# Altium project EVLSERVO1_control_v2.PrjPcb (part 6 of 9)
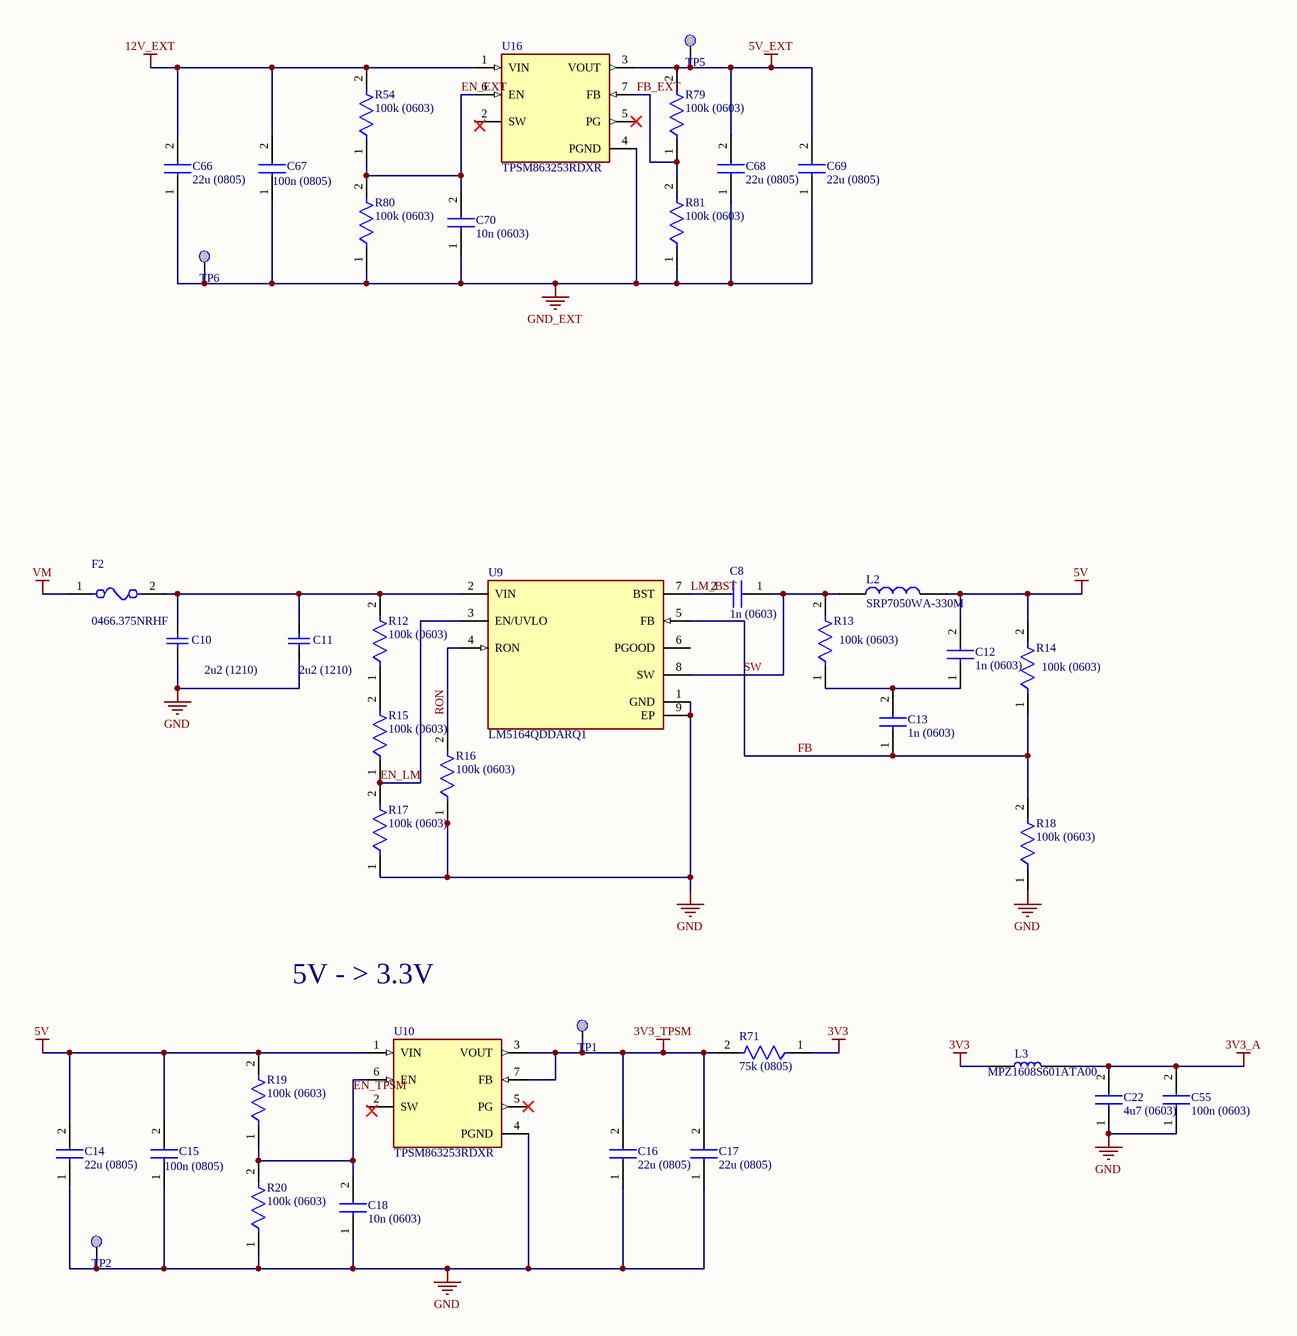
[diagram p9: power.SchDoc]

## Sheet power.SchDoc (continued)

### Library data of the parts (continued)
R19 R20 R54 R79-R81 = SR0603FR-7T100KL: Res Thick Film 0603 100K Ohm 1% 0.25W(1/4W) ±100ppm/°C Pad SMD T/R Automotive AEC-Q200; Manufacturer_Name: Yageo Group; Manufacturer_Part_Number: SR0603FR-7T10KL; Power Rating: 250mW; Value: 10kΩ; Voltage Rating: 75V; Working Voltage: 150V; Datasheet Link: https://mouser.componentsearchengine.com/Datasheets/1/SR0603FR-7T10KL.pdf; Height: 0.55mm; Mouser Part Number: 603-SR0603FR-7T10KL; Mouser Price/Stock: https://www.mouser.co.uk/ProductDetail/YAGEO/SR0603FR-7T10KL?qs=pfd5qewlna6IurLw3u3uRA%3D%3D; Arrow Part Number: SR0603FR-7T10KL; Arrow Price/Stock: https://www.arrow.com/en/products/sr0603fr-7t10kl/yageo; Supplier: DigiKey; Supplier Part Number: YAG5823CT-ND; Manufacturer: Yageo Group; Manufacturer Part Number: SR0603FR-7T10KL; RoHS: Compliant; Category: Chip SMD Resistors; Pricing: 1=0,67, 10=0,399, 25=0,3376, 50=0,3022, 100=0,2744, 250=0,24612, 500=0,22976, 1000=0,21675 (USD); Case/Package: 0603; China RoHS: Non-Compliant; Composition: Thick Film; Country of Origin: Mainland China, Taiwan; Export Control Classification Number (ECCN) Code: EAR99; Harmonized Tariff Schedule (HTS) Code: 8533.21.00.30; Introduction Date: 2017-10-02; Length: 1.6mm; Lifecycle Status: Production; Max Operating Temperature: 155°C; Min Operating Temperature: -55°C; Mounting Technology: Surface Mount; Number of Terminals: 2; Packaging: Tape & Reel; Ratings: AEC-Q200; REACH SVHC: Yes; Temperature Coefficient: 100ppm/°C; Tolerance: 1%; Width: 800µm; ComponentLink1URL: https://datasheet.octopart.com:443/SR0603FR-7T10KL-Yageo-datasheet-176402240.pdf?src-supplier=Farnell; ComponentLink1Description: https://datasheet.octopart.com:443/SR0603FR-7T10KL-Yageo-datasheet-176402240.pdf?src-supplier=Farnell; ComponentLink2URL: https://datasheet.octopart.com:443/SR0603FR-7T10KL-Yageo-datasheet-119732217.pdf?src-supplier=Upverter; ComponentLink2Description: https://datasheet.octopart.com:443/SR0603FR-7T10KL-Yageo-datasheet-119732217.pdf?src-supplier=Upverter; ComponentLink3URL: https://datasheet.octopart.com:443/SR0603FR-7T10KL-Yageo-Group-datasheet-184785656.pdf?src-supplier=Future+Electronics; ComponentLink3Description: https://datasheet.octopart.com:443/SR0603FR-7T10KL-Yageo-Group-datasheet-184785656.pdf?src-supplier=Future+Electronics; ComponentLink4URL: https://datasheet.octopart.com:443/SR0603FR-7T10KL-Yageo-datasheet-155675517.pdf?src-supplier=Future+Electronics; ComponentLink4Description: https://datasheet.octopart.com:443/SR0603FR-7T10KL-Yageo-datasheet-155675517.pdf?src-supplier=Future+Electronics; ComponentLink5URL: https://datasheet.octopart.com:443/SR0603FR-7T10KL-Yageo-datasheet-137701088.pdf?src-supplier=Future+Electronics; ComponentLink5Description: https://datasheet.octopart.com:443/SR0603FR-7T10KL-Yageo-datasheet-137701088.pdf?src-supplier=Future+Electronics; ComponentLink6URL: https://datasheet.octopart.com/SR0603FR-7T10KL-Yageo-datasheet-11047080.pdf; ComponentLink6Description: https://datasheet.octopart.com/SR0603FR-7T10KL-Yageo-datasheet-11047080.pdf; ComponentLink7URL: http://sigma.octopart.com:80/conflict_mineral_statement/Yageo-company-3.pdf?src-supplier=Compliance+Statements; ComponentLink7Description: http://sigma.octopart.com:80/conflict_mineral_statement/Yageo-company-3.pdf?src-supplier=Compliance+Statements; ComponentLink8URL: http://sigma.octopart.com:80/rohs_statement/Yageo-company-2.pdf?src-supplier=Compliance+Statements; ComponentLink8Description: http://sigma.octopart.com:80/rohs_statement/Yageo-company-2.pdf?src-supplier=Compliance+Statements; Stock: 5000; ComponentLink9URL: https://datasheet.octopart.com:443/SR0603FR-7T4R7L-Yageo-datasheet-176402240.pdf?src-supplier=Farnell; ComponentLink9Description: https://datasheet.octopart.com:443/SR0603FR-7T4R7L-Yageo-datasheet-176402240.pdf?src-supplier=Farnell; ComponentLink10URL: https://datasheet.octopart.com:443/SR0603FR-7T4R7L-Yageo-datasheet-119732217.pdf?src-supplier=Upverter; ComponentLink10Description: https://datasheet.octopart.com:443/SR0603FR-7T4R7L-Yageo-datasheet-119732217.pdf?src-supplier=Upverter; ComponentLink11URL: https://datasheet.octopart.com:443/SR0603FR-7T4R7L-Yageo-Group-datasheet-184785656.pdf?src-supplier=Future+Electronics; ComponentLink11Description: https://datasheet.octopart.com:443/SR0603FR-7T4R7L-Yageo-Group-datasheet-184785656.pdf?src-supplier=Future+Electronics; ComponentLink12URL: https://datasheet.octopart.com:443/SR0603FR-7T4R7L-Yageo-datasheet-155675517.pdf?src-supplier=Future+Electronics; ComponentLink12Description: https://datasheet.octopart.com:443/SR0603FR-7T4R7L-Yageo-datasheet-155675517.pdf?src-supplier=Future+Electronics; ComponentLink13URL: https://datasheet.octopart.com:443/SR0603FR-7T4R7L-Yageo-datasheet-137701088.pdf?src-supplier=Future+Electronics; ComponentLink13Description: https://datasheet.octopart.com:443/SR0603FR-7T4R7L-Yageo-datasheet-137701088.pdf?src-supplier=Future+Electronics; ComponentLink14URL: https://datasheet.octopart.com/SR0603FR-7T4R7L-Yageo-datasheet-11047080.pdf; ComponentLink14Description: https://datasheet.octopart.com/SR0603FR-7T4R7L-Yageo-datasheet-11047080.pdf; Schedule B: 8533210045, 8533210045|8533210045|8533210045|8533210045|8533210045; ComponentLink15URL: https://datasheet.octopart.com:443/SR0603FR-7T100KL-Yageo-datasheet-176402240.pdf?src-supplier=element14+APAC; ComponentLink15Description: https://datasheet.octopart.com:443/SR0603FR-7T100KL-Yageo-datasheet-176402240.pdf?src-supplier=element14+APAC; ComponentLink16URL: https://datasheet.octopart.com:443/SR0603FR-7T100KL-Yageo-datasheet-119732217.pdf?src-supplier=Upverter; ComponentLink16Description: https://datasheet.octopart.com:443/SR0603FR-7T100KL-Yageo-datasheet-119732217.pdf?src-supplier=Upverter; ComponentLink17URL: https://datasheet.octopart.com:443/SR0603FR-7T100KL-Yageo-Group-datasheet-184785656.pdf?src-supplier=Future+Electronics; ComponentLink17Description: https://datasheet.octopart.com:443/SR0603FR-7T100KL-Yageo-Group-datasheet-184785656.pdf?src-supplier=Future+Electronics; ComponentLink18URL: https://datasheet.octopart.com:443/SR0603FR-7T100KL-Yageo-datasheet-155675517.pdf?src-supplier=Future+Electronics; ComponentLink18Description: https://datasheet.octopart.com:443/SR0603FR-7T100KL-Yageo-datasheet-155675517.pdf?src-supplier=Future+Electronics; ComponentLink19URL: https://datasheet.octopart.com:443/SR0603FR-7T100KL-Yageo-datasheet-137701088.pdf?src-supplier=Future+Electronics; ComponentLink19Description: https://datasheet.octopart.com:443/SR0603FR-7T100KL-Yageo-datasheet-137701088.pdf?src-supplier=Future+Electronics; ComponentLink20URL: https://datasheet.octopart.com/SR0603FR-7T100KL-Yageo-datasheet-11047080.pdf; ComponentLink20Description: https://datasheet.octopart.com/SR0603FR-7T100KL-Yageo-datasheet-11047080.pdf
R71 = RQ73C2A75KBTD: Fixed Resistor, Thin Film, 0.2W, 75000ohm, 100V, 0.1% +/-Tol, 10ppm/Cel, Surface Mount, 0805; Manufacturer Part Number: SR0805FR-7W4R7L; Manufacturer: Yageo; Manufacturer Lifecycle Status: ACTIVE; Automotive Grade: Grade 0; Resistance: 4.7Ω; Tolerance: 0.01; Voltage Rating: 150V; Value: 4.7Ω; Power Rating: 0.25W; Temperature Coefficient: 10ppm/°C; Temperature Range High: +155°C; Digikey Description: RES SMD 4.7 OHM 1% 1/4W 0805; RoHS: TRUE; Ipc Land Pattern Name: RESC200125X50; Category: Res; Automotive: Yes; Device Class L2: Resistors; ComponentLink2Description: Datasheet; Device Class L1: Passive Components; Temperature Range Low: -55°C; Lead Free: Yes; Footprint Url: http://www.yageo.com/exep/pages/download/literatures/PYu-R_Mount_10.pdf; Octopart: https://octopart.com/sr0805fr-7w4r7l-yageo-71414350; Height: 0.6mm; Composition: Thick Film; Device Class L3: Chip SMD Resistors; Series: SR; ComponentLink2URL: http://www.yageo.com/documents/recent/PYu-SR_D_F%20tol_RoHS_L_3.pdf; Package: SR0805; Temperature: -55°C to +155°C; Supplier: Farnell; Supplier Part Number: RQ73C2A75KBTD; Stock: 3515; Case/Package: 0805; China RoHS: Compliant; Length: 2mm; Lifecycle Status: Production; Max Operating Temperature: 155°C; Min Operating Temperature: -55°C; Mounting Technology: Surface Mount; Number of Terminals: 2; Operating Supply Voltage: 100V; Ratings: AEC-Q200; REACH SVHC: Yes; Width: 1.25mm; Working Voltage: 100V; ComponentLink1URL: https://datasheet.octopart.com:443/RQ73C2A75KBTD-TE-Connectivity-datasheet-179163842.pdf?src-supplier=IHS; ComponentLink1Description: https://datasheet.octopart.com:443/RQ73C2A75KBTD-TE-Connectivity-datasheet-179163842.pdf?src-supplier=IHS; ComponentLink3URL: https://datasheet.octopart.com:443/RQ73C2A75KBTD-TE-Connectivity-datasheet-141404639.pdf?src-supplier=Upverter; ComponentLink3Description: https://datasheet.octopart.com:443/RQ73C2A75KBTD-TE-Connectivity-datasheet-141404639.pdf?src-supplier=Upverter; ComponentLink4URL: https://datasheet.octopart.com:443/RQ73C2A75KBTD-TE-Connectivity-datasheet-129104565.pdf?src-supplier=Electro+Sonic; ComponentLink4Description: https://datasheet.octopart.com:443/RQ73C2A75KBTD-TE-Connectivity-datasheet-129104565.pdf?src-supplier=Electro+Sonic; ComponentLink5URL: https://sigma.octopart.com:443/129121914/technical_drawing/TE-Connectivity-RQ73C2A75KBTD.pdf?src-supplier=TE+Connectivity; ComponentLink5Description: https://sigma.octopart.com:443/129121914/technical_drawing/TE-Connectivity-RQ73C2A75KBTD.pdf?src-supplier=TE+Connectivity; ComponentLink6URL: https://datasheet.octopart.com:443/7-2176381-6-TE-Connectivity-datasheet-181572785.pdf?src-supplier=Sager+Electronics; ComponentLink6Description: https://datasheet.octopart.com:443/7-2176381-6-TE-Connectivity-datasheet-181572785.pdf?src-supplier=Sager+Electronics
TP1 TP2 TP5 TP6 = TestPoint: Standard test point 1mm
U9 = CMP-04918-000331-1: POWER MANAGEMENT; RoHS Compliant: Yes
U10 U16 = TPSM863253RDXR: 3V to 17V input voltage, 3.3V, 3A output synchronous buck module in QFN package 7-QFN-FCMOD -40 to 125; Manufacturer Lifecycle Status: ACTIVE; MF: Texas Instruments; SnapEDA_Link: https://www.snapeda.com/parts/TPSM863253RDXR/Texas+Instruments/view-part/?ref=snap; Package: None; Value: *; MP: TPSM863253RDXR; Check_prices: https://www.snapeda.com/parts/TPSM863253RDXR/Texas+Instruments/view-part/?ref=eda; Supplier: DigiKey; Supplier Part Number: 296-TPSM863253RDXRCT-ND; Manufacturer: Texas Instruments; Manufacturer Part Number: TPSM863253RDXR; RoHS: Compliant; Category: Integrated Circuits (ICs); Stock: 3257; Pricing: 1=2,63, 10=1,96, 25=1,7924, 100=1,6078, 250=1,51976, 500=1,46668, 1000=1,42301 (USD); Height: 0m; Length: 4mm; Lifecycle Status: Production; Pins: 7; Thickness: 2mm; Width: 3.3mm; ComponentLink1URL: https://octopart.com:443/opatz8j6/c1?t=jS2VDNp59x-r3M4UnJwIkxDyXkbjHNSAoP2Fns5-Wk80kLlb-mQ5gVuk8zyi84j77RuBrZF-262aE3noOfDKcDGPEWkV9DoDQewFCLFFRyInceCxvVyAfhTYCYIywjkPWDqBy3YcbHQILjtWA_Eaj3WAHosXV5eHD7vpZYJjVrSO88bXdsuSYdlpSx9vUfFmQgFuFA-HMfKLGSBXL49TLOzJ5T2tngLQpQw-KF5iF-olhgVCegbBT0_kXe8-zNmOJ90ZL3AMoFtxFgWXTiA3kg8TbPVDzmO9NJcakYYdjuReFGLrhU-Lh8uurvImosMTR0LFVg6PaXdiPOKNUC1j5THOrz5of0wHKRbirvbX2rJGgWFTmZxbk0I20_VZT7Zu5rI_wToFdFWt&src-supplier=Texas+Instruments; ComponentLink1Description: https://octopart.com:443/opatz8j6/c1?t=jS2VDNp59x-r3M4UnJwIkxDyXkbjHNSAoP2Fns5-Wk80kLlb-mQ5gVuk8zyi84j77RuBrZF-262aE3noOfDKcDGPEWkV9DoDQewFCLFFRyInceCxvVyAfhTYCYIywjkPWDqBy3YcbHQILjtWA_Eaj3WAHosXV5eHD7vpZYJjVrSO88bXdsuSYdlpSx9vUfFmQgFuFA-HMfKLGSBXL49TLOzJ5T2tngLQpQw-KF5iF-olhgVCegbBT0_kXe8-zNmOJ90ZL3AMoFtxFgWXTiA3kg8TbPVDzmO9NJcakYYdjuReFGLrhU-Lh8uurvImosMTR0LFVg6PaXdiPOKNUC1j5THOrz5of0wHKRbirvbX2rJGgWFTmZxbk0I20_VZT7Zu5rI_wToFdFWt&src-supplier=Texas+Instruments; ComponentLink2URL: https://datasheet.octopart.com:443/TPSM863253RDXR-Texas-Instruments-datasheet-184174687.pdf?src-supplier=LCSC; ComponentLink2Description: https://datasheet.octopart.com:443/TPSM863253RDXR-Texas-Instruments-datasheet-184174687.pdf?src-supplier=LCSC; ComponentLink3URL: http://sigma.octopart.com:80/reach_statement/Texas-Instruments-company-64.pdf?src-supplier=Compliance+Statements; ComponentLink3Description: http://sigma.octopart.com:80/reach_statement/Texas-Instruments-company-64.pdf?src-supplier=Compliance+Statements; ComponentLink4URL: http://sigma.octopart.com:80/conflict_mineral_statement/Texas-Instruments-company-63.pdf?src-supplier=Compliance+Statements; ComponentLink4Description: http://sigma.octopart.com:80/conflict_mineral_statement/Texas-Instruments-company-63.pdf?src-supplier=Compliance+Statements

## Sheet stspin32g4.SchDoc
size A3; SheetNumber: 2; SheetTotal: 4
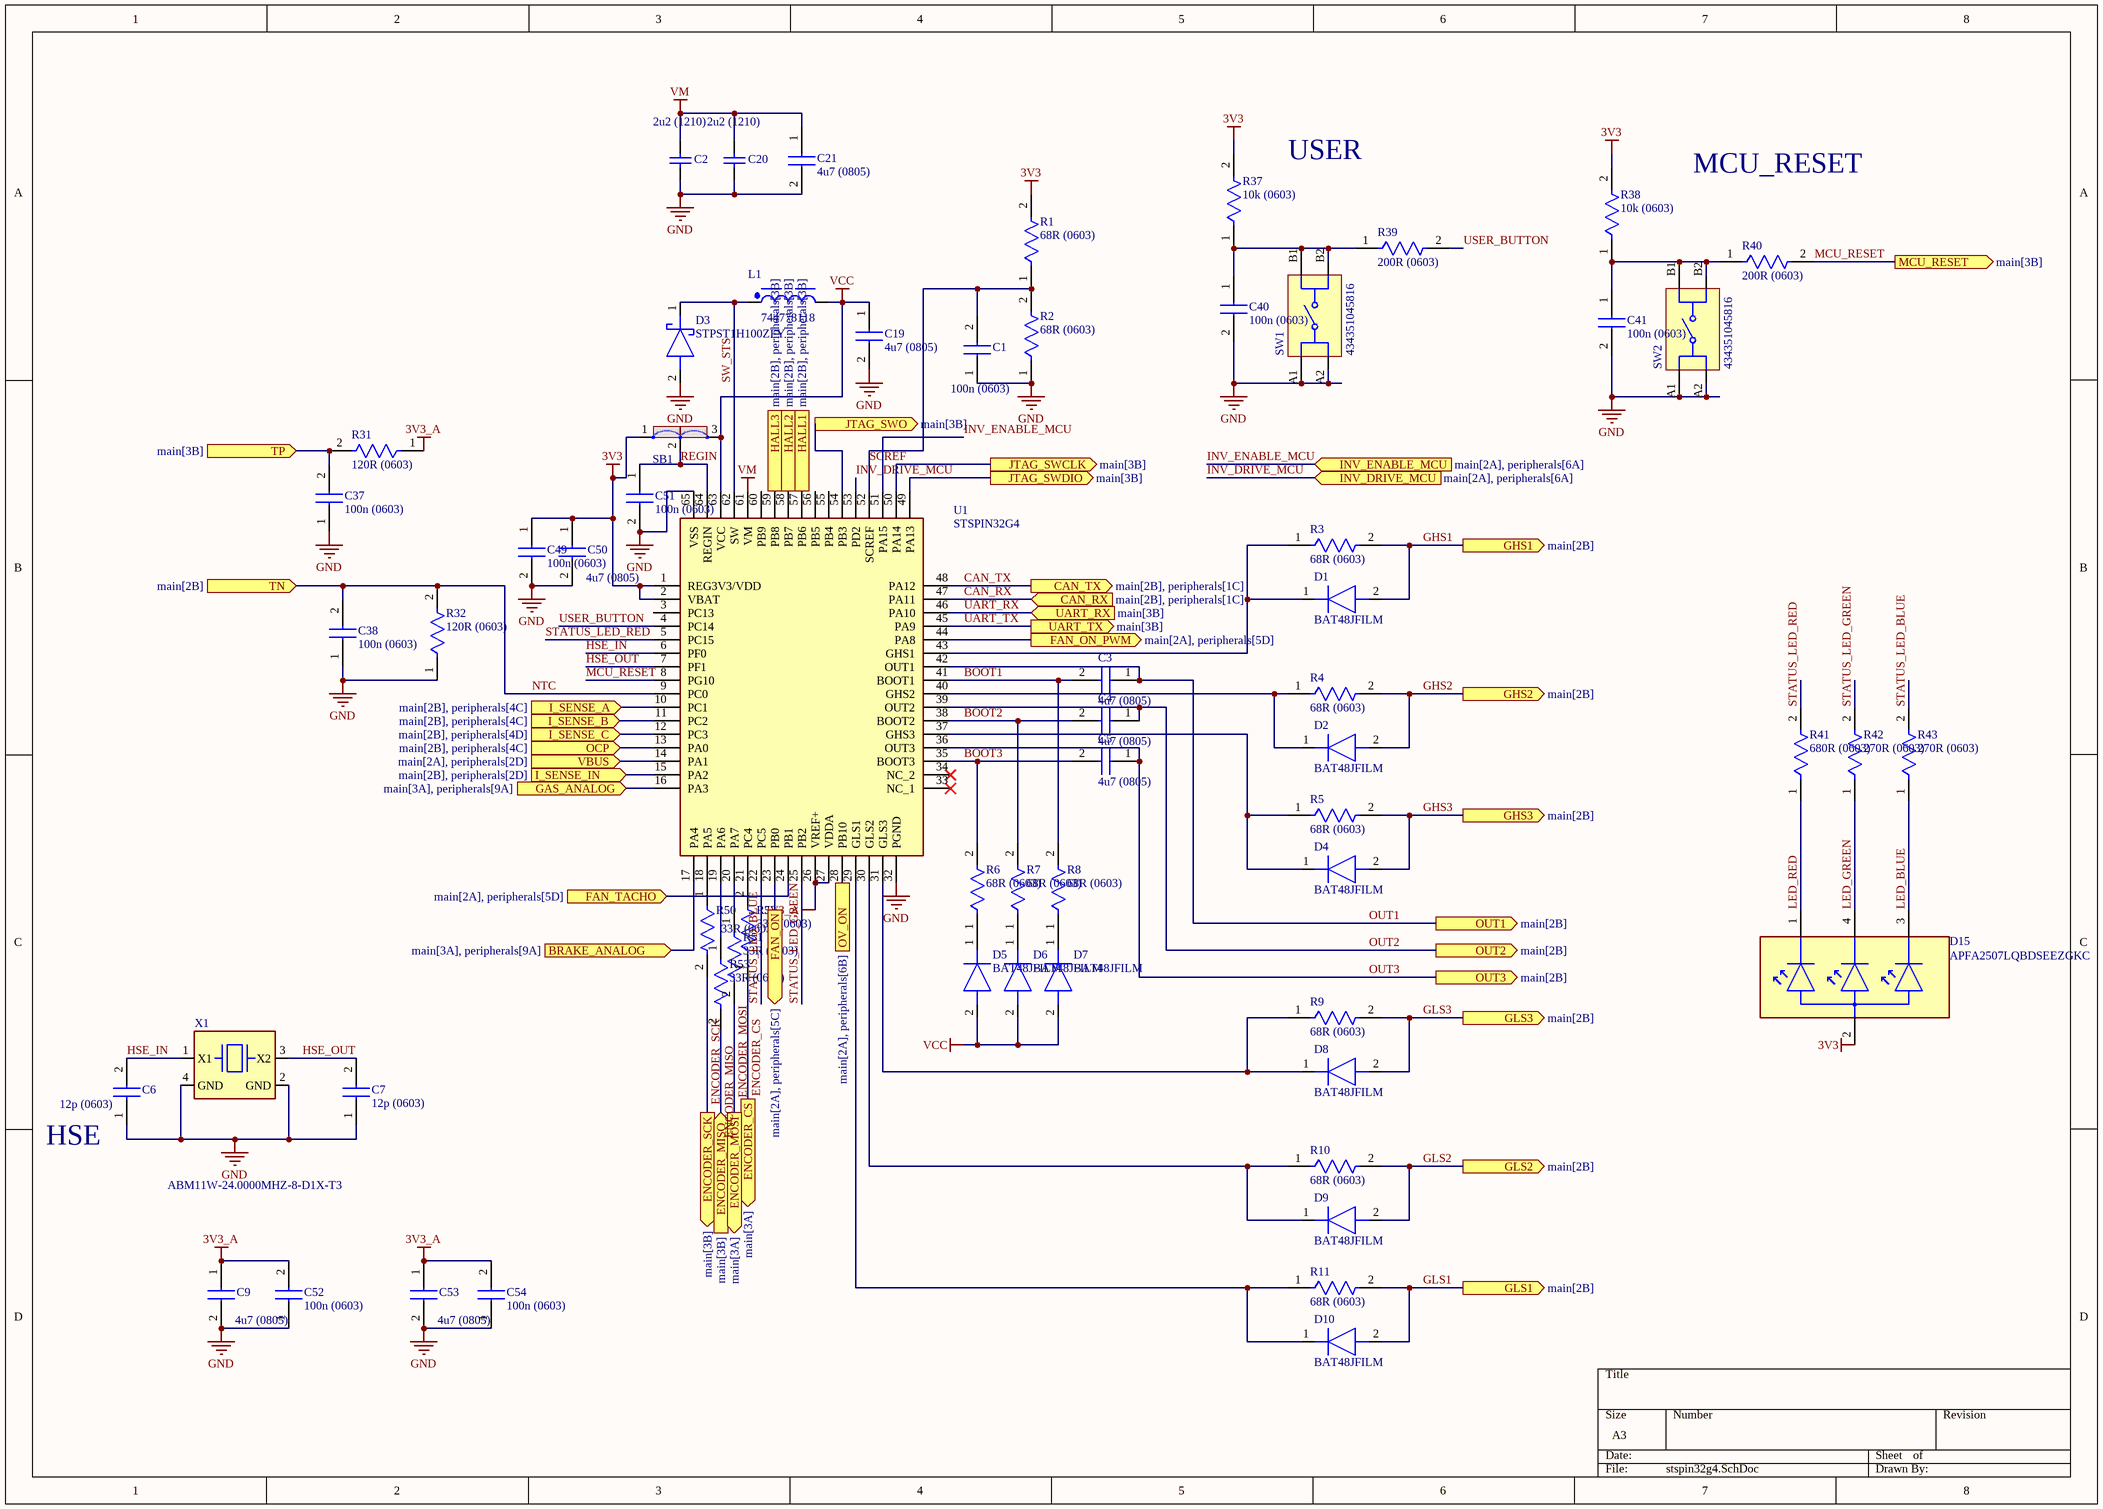
[diagram p4: stspin32g4.SchDoc]

### Parts
C1  100n (0603)  [C0603]
C2  2u2 (1210)  [WCAP-CSGP_1210_L3.2W2.5H2.5]
C3  4u7 (0805)  [C0805]
C4  4u7 (0805)  [C0805]
C5  4u7 (0805)  [C0805]
C6  12p (0603)  [C0603]
C7  12p (0603)  [C0603]
C9  4u7 (0805)  [C0805]
C19  4u7 (0805)  [C0805]
C20  2u2 (1210)  [WCAP-CSGP_1210_L3.2W2.5H2.5]
C21  4u7 (0805)  [C0805]
C37  100n (0603)  [C0603]
C38  100n (0603)  [C0603]
C40  100n (0603)  [C0603]
C41  100n (0603)  [C0603]
C49  100n (0603)  [C0603]
C50  4u7 (0805)  [C0805]
C51  100n (0603)  [C0603]
C52  100n (0603)  [C0603]
C53  4u7 (0805)  [C0805]
C54  100n (0603)  [C0603]
D1  BAT48JFILM  [SOD2513X117N]
D2  BAT48JFILM  [SOD2513X117N]
D3  STPST1H100ZFY  [SODFL3516X110N]
D4  BAT48JFILM  [SOD2513X117N]
D5  BAT48JFILM  [SOD2513X117N]
D6  BAT48JFILM  [SOD2513X117N]
D7  BAT48JFILM  [SOD2513X117N]
D8  BAT48JFILM  [SOD2513X117N]
D9  BAT48JFILM  [SOD2513X117N]
D10  BAT48JFILM  [SOD2513X117N]
D15  APFA2507LQBDSEEZGKC  [FP-APFA2507LQBDSEEZGKC-MFG]
L1  744778118  [WE-PD_7332]
R1  68R (0603)  [R0603]
R2  68R (0603)  [R0603]
R3  68R (0603)  [R0603]
R4  68R (0603)  [R0603]
R5  68R (0603)  [R0603]
R6  68R (0603)  [R0603]
R7  68R (0603)  [R0603]
R8  68R (0603)  [R0603]
R9  68R (0603)  [R0603]
R10  68R (0603)  [R0603]
R11  68R (0603)  [R0603]
R31  120R (0603)  [R0603]
R32  120R (0603)  [R0603]
R37  10k (0603)  [R0603]
R38  10k (0603)  [R0603]
R39  200R (0603)  [R0603]
R40  200R (0603)  [R0603]
R41  680R (0603)  [R0603]
R42  270R (0603)  [R0603]
R43  270R (0603)  [R0603]
R50  33R (0603)  [R0603]
R51  33R (0603)  [R0603]
R52  33R (0603)  [R0603]
R53  33R (0603)  [R0603]
SB1  triple_solder_jumper  [triple_solder_jumper]  (value not drawn)
SW1  434351045816  [434351045816]
SW2  434351045816  [434351045816]
U1  STSPIN32G4  [QFN50P900X900X100-65N-D]
X1  ABM11W-24.0000MHZ-8-D1X-T3  [XTAL_ABM11W-24.0000MHZ-8-D1X-T3]

### Ports
BRAKE_ANALOG (in, see main[3A], peripherals[9A]), CAN_RX (in, see main[2B], peripherals[1C]), CAN_TX (out, see main[2B], peripherals[1C]), ENCODER_CS (out, see main[3A]), ENCODER_MISO (in, see main[3B]), ENCODER_MOSI (out, see main[3A]), ENCODER_SCK (out, see main[3B]), FAN_ON (out, see main[2A], peripherals[5C]), FAN_ON_PWM (out, see main[2A], peripherals[5D]), FAN_TACHO (in, see main[2A], peripherals[5D]), GAS_ANALOG (in, see main[3A], peripherals[9A]), GHS1 (out, see main[2B]), GHS2 (out, see main[2B]), GHS3 (out, see main[2B]), GLS1 (out, see main[2B]), GLS2 (out, see main[2B]), GLS3 (out, see main[2B]), HALL1 (in, see main[2B], peripherals[3B]), HALL2 (in, see main[2B], peripherals[3B]), HALL3 (in, see main[2B], peripherals[3B]), I_SENSE_A (in, see main[2B], peripherals[4C]), I_SENSE_B (in, see main[2B], peripherals[4C]), I_SENSE_C (in, see main[2B], peripherals[4D]), I_SENSE_IN (in, see main[2B], peripherals[2D]), INV_DRIVE_MCU (in, see main[2A], peripherals[6A]), INV_ENABLE_MCU (in, see main[2A], peripherals[6A]), JTAG_SWCLK (out, see main[3B]), JTAG_SWDIO (out, see main[3B]), JTAG_SWO (out, see main[3B]), MCU_RESET (out, see main[3B]), OCP (in, see main[2B], peripherals[4C]), OUT1 (out, see main[2B]), OUT2 (out, see main[2B]), OUT3 (out, see main[2B]), OV_ON (out, see main[2A], peripherals[6B]), TN (in, see main[2B]), TP (in, see main[3B]), UART_RX (in, see main[3B]), UART_TX (out, see main[3B]), VBUS (in, see main[2A], peripherals[2D])

### Nets
3V3: C49.1 C50.1 D15.2(COMMON_ANODE) R1.2 R37.2 R38.2 SB1.1 U1.1(REG3V3/VDD) U1.2(VBAT)
3V3_A: C9.1 C52.2 C53.1 C54.2 R31.1 U1.26(VREF+) U1.27(VDDA)
GND: C1.1 C2.1 C6.1 C7.1 C9.2 C19.2 C20.1 C21.2 C37.1 C38.1 C40.2 C41.2 C49.2 C50.2 C51.2 C52.1 C53.2 C54.1 D3.2(A) R2.1 R32.1 SW1.A1 SW1.A2 SW2.A1 SW2.A2 U1.32(PGND) U1.65(VSS) X1.2(GND) X1.4(GND)
VCC: C19.1 D5.2(A) D6.2(A) D7.2(A) L1.2 SB1.3 U1.63(VCC)
VM: C2.2 C20.2 C21.1 U1.61(VM)
BOOT1: C3.2 R8.2 U1.41(BOOT1)
BOOT2: C4.2 R7.2 U1.38(BOOT2)
BOOT3: C5.2 R6.2 U1.35(BOOT3)
BRAKE_ANALOG: U1.17(PA4) ; port BRAKE_ANALOG
CAN_RX: U1.47(PA11) ; port CAN_RX
CAN_TX: U1.48(PA12) ; port CAN_TX
ENCODER_CS: R52.1 ; port ENCODER_CS
ENCODER_MISO: R53.2 ; port ENCODER_MISO
ENCODER_MOSI: R51.2 ; port ENCODER_MOSI
ENCODER_SCK: R50.2 ; port ENCODER_SCK
FAN_ON: U1.23(PB0) ; port FAN_ON
FAN_PWM_ON: U1.44(PA8) ; port FAN_ON_PWM
FAN_TACHO: U1.24(PB1) ; port FAN_TACHO
GAS_ANALOG: U1.16(PA3) ; port GAS_ANALOG
GHS1: D1.2(A) R3.2 ; port GHS1
GHS2: D2.2(A) R4.2 ; port GHS2
GHS3: D4.2(A) R5.2 ; port GHS3
GLS1: D10.2(A) R11.2 ; port GLS1
GLS2: D9.2(A) R10.2 ; port GLS2
GLS3: D8.2(A) R9.2 ; port GLS3
HSE_IN: C6.2 U1.6(PF0) X1.1(X1)
HSE_OUT: C7.2 U1.7(PF1) X1.3(X2)
I_SENSE_A: U1.10(PC1) ; port I_SENSE_A
I_SENSE_B: U1.11(PC2) ; port I_SENSE_B
I_SENSE_C: U1.12(PC3) ; port I_SENSE_C
INV_DRIVE_MCU: U1.53(PD2) ; port INV_DRIVE_MCU
INV_ENABLE_MCU: U1.51(PA15) ; port INV_ENABLE_MCU
JTAG_SWCLK: U1.50(PA14) ; port JTAG_SWCLK
JTAG_SWDIO: U1.49(PA13) ; port JTAG_SWDIO
JTAG_SWO: U1.54(PB3) ; port JTAG_SWO
LED_BLUE: D15.3(RED_C) R43.1
LED_GREEN: D15.4(GREEN_C) R42.1
LED_RED: D15.1(BLUE_C) R41.1
MCU_RESET: R40.2 U1.8(PG10) ; port MCU_RESET
NTC: C38.2 R32.2 U1.9(PC0) ; port TN
OCP: U1.13(PA0) ; port OCP
OUT1: C3.1 U1.42(OUT1) ; port OUT1
OUT2: C4.1 U1.39(OUT2) ; port OUT2
OUT3: C5.1 U1.36(OUT3) ; port OUT3
OV_ON: U1.28(PB10) ; port OV_ON
REGIN: C51.1 SB1.2 U1.64(REGIN)
SCREF: C1.2 R1.1 R2.2 U1.52(SCREF)
STATUS_LED_BLUE: R43.2 U1.22(PC5)
STATUS_LED_GREEN: R42.2 U1.25(PB2)
STATUS_LED_RED: R41.2 U1.5(PC15)
SW_STS: D3.1(K) L1.1 U1.62(SW)
TP: C37.2 R31.2 ; port TP
UART_RX: U1.46(PA10) ; port UART_RX
UART_TX: U1.45(PA9) ; port UART_TX
USER_BUTTON: R39.2 U1.4(PC14)
VBUS: U1.14(PA1) ; port VBUS
NetC29_2: U1.15(PA2) ; port I_SENSE_IN
NetC40_1: C40.1 R37.1 R39.1 SW1.B1 SW1.B2
NetC41_1: C41.1 R38.1 R40.1 SW2.B1 SW2.B2
NetC42_2: U1.57(PB6) ; port HALL1
NetC43_2: U1.58(PB7) ; port HALL2
NetC44_2: U1.59(PB8) ; port HALL3
NetD1_1: D1.1(K) R3.1 U1.43(GHS1)
NetD2_1: D2.1(K) R4.1 U1.40(GHS2)
NetD4_1: D4.1(K) R5.1 U1.37(GHS3)
NetD5_1: D5.1(K) R6.1
NetD6_1: D6.1(K) R7.1
NetD7_1: D7.1(K) R8.1
NetD8_1: D8.1(K) R9.1 U1.31(GLS3)
NetD9_1: D9.1(K) R10.1 U1.30(GLS2)
NetD10_1: D10.1(K) R11.1 U1.29(GLS1)
NetR50_1: R50.1 U1.18(PA5)
NetR51_1: R51.1 U1.20(PA7)
NetR52_2: R52.2 U1.21(PC4)
NetR53_1: R53.1 U1.19(PA6)

Not connected (* = marked no-connect by the designer): U1 3(PC13) 33(NC_1)* 34(NC_2)* 55(PB4) 56(PB5) 60(PB9)

### Notes on the sheet
- USER
- MCU_RESET
- (near C6) HSE